# Altium project MAXM86161_ADPTR_EVKIT_B.PrjPcb
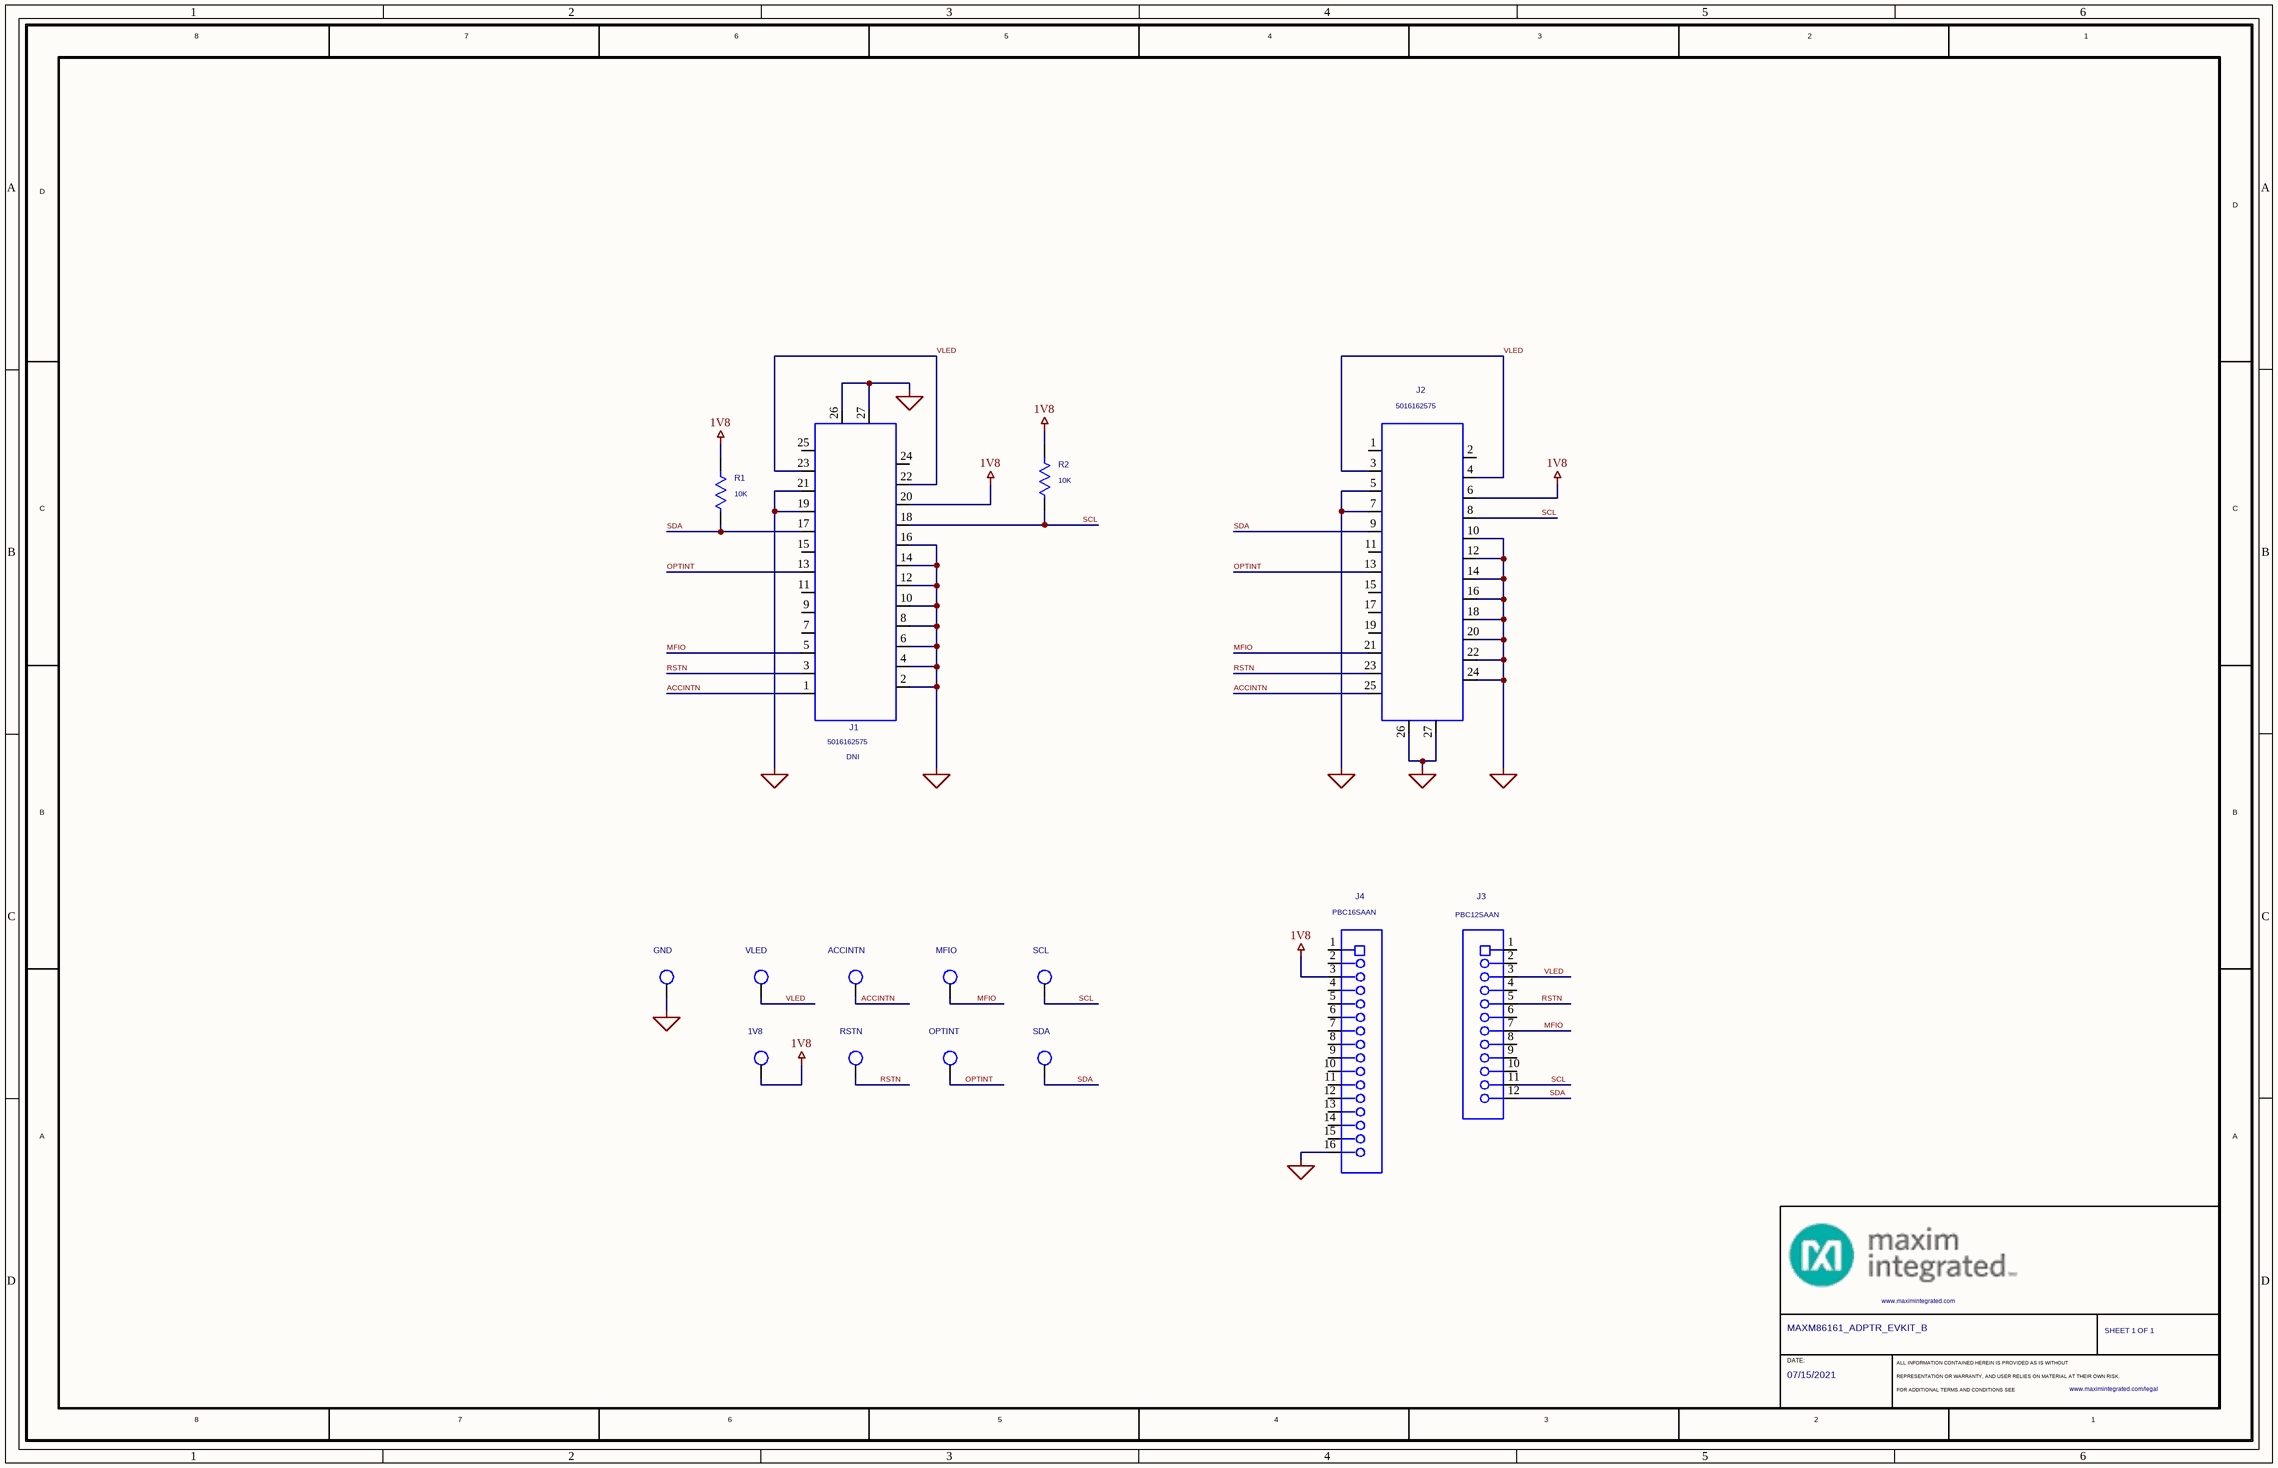
[diagram p0: MAXM86161_ADPTR_EVKIT_B.SchDoc]
1 sheet, 16 parts. Net scope: global (net labels, ports and power ports of the same name join across sheets).

## Sheet MAXM86161_ADPTR_EVKIT_B.SchDoc
size 426 x 274 mm

### Parts
1V8  N/A  [KEYS_5011]  (value not drawn)
*  CUSTOM_TXT_CDS21: SHEET 1 OF 1  PROJECT_TITLE: MAXM86161_ADPTR_EVKIT_B  DATE: 07/15/2021  (hidden comment: MAXIM_B_SIZE_CF)  (graphical)
ACCINTN  N/A  [KEYS_5013]  (value not drawn)
GND  N/A  [KEYS_5011]  (value not drawn)
J1  5016162575  LABEL: DNI  [MOLEX_501616-2575]
J2  5016162575  [MOLEX_501616-2575]
J3  PBC12SAAN  [SULLINS_PXC12SAAN]
J4  PBC16SAAN  [SULLINS_PXC16SAAN]
MFIO  N/A  [KEYS_5127]  (value not drawn)
OPTINT  N/A  [KEYS_5126]  (value not drawn)
R1  10K  [RESC6432X76M]
R2  10K  [RESC6432X76M]
RSTN  N/A  [KEYS_5014]  (value not drawn)
SCL  N/A  [KEYSTONE_5128]  (value not drawn)
SDA  N/A  [TP_C340H160]  (value not drawn)
VLED  N/A  [KEYS_5012]  (value not drawn)

### Nets
1V8: 1V8.1(TP1) J1.20 J2.6 J4.3 R1.1 R2.1
GND_SIGNAL_1: GND.1(TP1) J1.2 J1.4 J1.6 J1.8 J1.10 J1.12 J1.14 J1.16 J1.19 J1.21 J1.26 J1.27 J2.5 J2.7 J2.10 J2.12 J2.14 J2.16 J2.18 J2.20 J2.22 J2.24 J2.26 J2.27 J4.16
ACCINTN: ACCINTN.1(TP1) J1.1 J2.25
MFIO: J1.5 J2.21 J3.7 MFIO.1(TP1)
OPTINT: J1.13 J2.13 OPTINT.1(TP1)
RSTN: J1.3 J2.23 J3.5 RSTN.1(TP1)
SCL: J1.18 J2.8 J3.11 R2.2 SCL.1(TP1)
SDA: J1.17 J2.9 J3.12 R1.2 SDA.1(TP1)
VLED: J1.22 J1.23 J2.3 J2.4 J3.3 VLED.1(TP1)

Not connected (* = marked no-connect by the designer): J1 7 9 11 15 24 25; J2 1 2 11 15 17 19; J3 1 2 4 6 8 9 10; J4 1 2 4 5 6 7 8 9 10 11 12 13 14 15

### Notes on the sheet
- (in symbol MAXIM_B_SIZE_CF) 8; 7; 6; 5; 4; 3; 2; D; C; B; A; DATE:; ALL INFORMATION CONTAINED HEREIN IS PROVIDED AS IS WITHOUT; REPRESENTATION OR WARRANTY, AND USER RELIES ON MATERIAL AT THEIR OWN RISK.; FOR ADDITIONAL TERMS AND CONDITIONS SEE

### Library data of the parts
1V8 GND = TP: TEST POINT; PIN DIA=0.125IN; TOTAL LENGTH=0.445IN; BOARD HOLE=0.063IN; BLACK; PHOSPHOR BRONZE WIRE SILVER PLATE FINISH; RECOMMENDED FOR BOARD THICKNESS=0.062IN; NOT FOR COLD TEST; MFG_PART_NUMBER: 5011; MANUFACTURER: KEYSTONE; OriginalSymbolOrigin: (-125,50); MAXINV: 02-TPMINI5011-00; DRAWING: @MAXM86161_ADPTR_EVKIT_B_LIB.MAXM86161_ADPTR_EVKIT_B(SCH_1):PAGE2; PHYS_PAGE: 1; PACK_TYPE: TP; PCB Footprint_: KEYS_5011; PART_NAME: TP; REFLOW: -; TOLERANCE: N/A; VER: 1; VOLTAGE_RATING: N/A; TEMP_RANGE: N/A
* = MAXIM_B_SIZE_CF: OriginalSymbolOrigin: (175,5230); COMMENT_BODY: TRUE; Page Number: 1; CURRENT_DESIGN_SHEET: Page_1; LEAGAL_WEBLINK: www.maximintegrated.com/legal; WEBLINK1: www.maximintegrated.com
ACCINTN = TP: TEST POINT; PIN DIA=0.125IN; TOTAL LENGTH=0.445IN; BOARD HOLE=0.063IN; ORANGE; PHOSPHOR BRONZE WIRE SILVER PLATE FINISH; RECOMMENDED FOR BOARD THICKNESS=0.062IN; NOT FOR COLD TEST; MFG_PART_NUMBER: 5013; MANUFACTURER: KEYSTONE; OriginalSymbolOrigin: (-125,50); MAXINV: 02-TPMINI5013-00; DRAWING: @MAXM86161_ADPTR_EVKIT_B_LIB.MAXM86161_ADPTR_EVKIT_B(SCH_1):PAGE2; PHYS_PAGE: 1; PACK_TYPE: TP; PCB Footprint_: KEYS_5013; PART_NAME: TP; REFLOW: -; TOLERANCE: N/A; VER: 1; VOLTAGE_RATING: N/A; TEMP_RANGE: N/A
J1 = 501616-2575: CONNECTOR; FEMALE; SMT; EASY-ON TYPE FPC CONNECTOR; RIGHT ANGLE; 25PINS ;NOTE:DISCONTINUED BY MANUFACTURER; MANUFACTURER: MOLEX; OriginalSymbolOrigin: (-150,550); PACK_TYPE: RA; MAXINV: 01-501616257525P-29; DRAWING: @MAXM86161_ADPTR_EVKIT_B_LIB.MAXM86161_ADPTR_EVKIT_B(SCH_1):PAGE2; PHYS_PAGE: 1; VOLTAGE_RATING: +50V; TEMP_RANGE: -40 DEGC TO +85 DEGC; PCB Footprint_: MOLEX_501616-2575; MFG_PART_NUMBER: 5016162575; REFLOW: -; SEC_TYPE: RA; TOLERANCE: N/A; VARIANT: DNI; VER: 1
J2 = 501616-2575: CONNECTOR; FEMALE; SMT; EASY-ON TYPE FPC CONNECTOR; RIGHT ANGLE; 25PINS ;NOTE:DISCONTINUED BY MANUFACTURER; MANUFACTURER: MOLEX; OriginalSymbolOrigin: (-150,550); PACK_TYPE: RA; MAXINV: 01-501616257525P-29; DRAWING: @MAXM86161_ADPTR_EVKIT_B_LIB.MAXM86161_ADPTR_EVKIT_B(SCH_1):PAGE2; PHYS_PAGE: 1; VARIANT: DNI; VOLTAGE_RATING: +50V; TEMP_RANGE: -40 DEGC TO +85 DEGC; PCB Footprint_: MOLEX_501616-2575; MFG_PART_NUMBER: 5016162575; REFLOW: -; SEC_TYPE: RA; TOLERANCE: N/A; VER: 1
J3 = HEADER_12P: CONNECTOR; MALE; THROUGH HOLE; BREAKAWAY; STRAIGHT; 12PINS; -65 DEGC TO +125 DEGC; MANUFACTURER: SULLINS ELECTRONICS CORP.; OriginalSymbolOrigin: (-75,375); PACK_TYPE: SIP; MAXINV: 01-PBC12SAAN12P-21; DRAWING: @MAXM86161_ADPTR_EVKIT_B_LIB.MAXM86161_ADPTR_EVKIT_B(SCH_1):PAGE2; PHYS_PAGE: 1; PCB Footprint_: SULLINS_PXC12SAAN; MFG_PART_NUMBER: PBC12SAAN; REFLOW: -; SEC_TYPE: SIP; TOLERANCE: N/A; VER: 1; VOLTAGE_RATING: N/A; TEMP_RANGE: -65 DEGC TO +125 DEGC
J4 = HEADER_16P: CONNECTOR; MALE; THROUGH HOLE; BREAKAWAY; STRAIGHT; 16PINS; -65 DEGC TO +125 DEGC; MANUFACTURER: SULLINS ELECTRONICS CORP.; OriginalSymbolOrigin: (-75,475); PACK_TYPE: SIP; MAXINV: 01-PBC16SAAN16P-21; DRAWING: @MAXM86161_ADPTR_EVKIT_B_LIB.MAXM86161_ADPTR_EVKIT_B(SCH_1):PAGE2; PHYS_PAGE: 1; PCB Footprint_: SULLINS_PXC16SAAN; MFG_PART_NUMBER: PBC16SAAN; REFLOW: -; SEC_TYPE: SIP; TOLERANCE: N/A; VER: 1; VOLTAGE_RATING: N/A; TEMP_RANGE: -65 DEGC TO +125 DEGC
MFIO = TP: TEST POINT; PIN DIA=0.125IN; TOTAL LENGTH=0.445IN; BOARD HOLE=0.063IN; BLUE; PHOSPHOR BRONZE WIRE SILVER PLATE FINISH; RECOMMENDED FOR BOARD THICKNESS=0.062IN; NOT FOR COLD TEST; MFG_PART_NUMBER: 5127; MANUFACTURER: KEYSTONE; OriginalSymbolOrigin: (-125,50); MAXINV: 02-TPMULTI5127-00; DRAWING: @MAXM86161_ADPTR_EVKIT_B_LIB.MAXM86161_ADPTR_EVKIT_B(SCH_1):PAGE2; PHYS_PAGE: 1; PACK_TYPE: TP; PCB Footprint_: KEYS_5127; PART_NAME: TP; REFLOW: -; TOLERANCE: N/A; VER: 1; VOLTAGE_RATING: N/A; TEMP_RANGE: N/A
OPTINT = TP: TEST POINT; PIN DIA=0.125IN; TOTAL LENGTH=0.445IN; BOARD HOLE=0.063IN; GREEN; PHOSPHOR BRONZE WIRE SILVER PLATE FINISH; RECOMMENDED FOR BOARD THICKNESS=0.062IN; NOT FOR COLD TEST; MFG_PART_NUMBER: 5126; MANUFACTURER: KEYSTONE; OriginalSymbolOrigin: (-125,50); MAXINV: 02-TPMULTI5126-00; DRAWING: @MAXM86161_ADPTR_EVKIT_B_LIB.MAXM86161_ADPTR_EVKIT_B(SCH_1):PAGE2; PHYS_PAGE: 1; PACK_TYPE: TP; PCB Footprint_: KEYS_5126; PART_NAME: TP; REFLOW: -; TOLERANCE: N/A; VER: 1; VOLTAGE_RATING: N/A; TEMP_RANGE: N/A
R1 = RES_SMD: RES; SMT (2512); 10K; 1%; +/-100PPM/DEGC; 2W; MFG_PART_NUMBER: HVC2512K1002FT; MANUFACTURER: OHMCRAFT; OriginalSymbolOrigin: (-50,75); PACK_TYPE: 2512RES; MAXINV: 80-0010K-AA72; DRAWING: @MAXM86161_ADPTR_EVKIT_B_LIB.MAXM86161_ADPTR_EVKIT_B(SCH_1):PAGE2; PHYS_PAGE: 1; RES: 1.00E04; VER: 4; TEMP_RANGE: -55 DEGC TO +150 DEGC; VLOG_PARAM01: RES:INTEGER; MATERIAL_TYPE: THICK FILM; PCB Footprint_: RESC6432X76M; CASE: SMT (2512); POWER_RATING: 2W; REFLOW: -; TOLERANCE: 1%
R2 = RES_SMD: RES; SMT (2512); 10K; 1%; +/-100PPM/DEGC; 2W; MFG_PART_NUMBER: HVC2512K1002FT; MANUFACTURER: OHMCRAFT; OriginalSymbolOrigin: (-50,75); PACK_TYPE: 2512RES; MAXINV: 80-0010K-AA72; DRAWING: @MAXM86161_ADPTR_EVKIT_B_LIB.MAXM86161_ADPTR_EVKIT_B(SCH_1):PAGE2; PHYS_PAGE: 1; RES: 1.00E04; VER: 4; TEMP_RANGE: -55 DEGC TO +150 DEGC; MATERIAL_TYPE: THICK FILM; VLOG_PARAM01: RES:INTEGER; PCB Footprint_: RESC6432X76M; CASE: SMT (2512); POWER_RATING: 2W; REFLOW: -; TOLERANCE: 1%
RSTN = TP: TEST POINT; PIN DIA=0.125IN; TOTAL LENGTH=0.445IN; BOARD HOLE=0.063IN; YELLOW; PHOSPHOR BRONZE WIRE SILVER PLATE FINISH; RECOMMENDED FOR BOARD THICKNESS=0.062IN; NOT FOR COLD TEST; MFG_PART_NUMBER: 5014; MANUFACTURER: KEYSTONE; OriginalSymbolOrigin: (-125,50); MAXINV: 02-TPMINI5014-00; DRAWING: @MAXM86161_ADPTR_EVKIT_B_LIB.MAXM86161_ADPTR_EVKIT_B(SCH_1):PAGE2; PHYS_PAGE: 1; PACK_TYPE: TP; PCB Footprint_: KEYS_5014; PART_NAME: TP; REFLOW: -; TOLERANCE: N/A; VER: 1; VOLTAGE_RATING: N/A; TEMP_RANGE: N/A
SCL = TP: TEST POINT; PIN DIA=0.125IN; TOTAL LENGTH=0.445IN; BOARD HOLE=0.063IN; GREY; PHOSPHOR BRONZE WIRE SILVER PLATE FINISH; RECOMMENDED FOR BOARD THICKNESS=0.062IN; NOT FOR COLD TEST; MFG_PART_NUMBER: 5128; MANUFACTURER: KEYSTONE; OriginalSymbolOrigin: (-125,50); MAXINV: 02-TPMULTI5128-00; DRAWING: @MAXM86161_ADPTR_EVKIT_B_LIB.MAXM86161_ADPTR_EVKIT_B(SCH_1):PAGE2; PHYS_PAGE: 1; PACK_TYPE: TP; PCB Footprint_: KEYSTONE_5128; PART_NAME: TP; REFLOW: -; TOLERANCE: N/A; VER: 1; VOLTAGE_RATING: N/A; TEMP_RANGE: N/A
SDA = TP: TEST POINT; PIN DIA=0.125IN; TOTAL LENGTH=0.445IN; BOARD HOLE=0.063IN; BROWN; PHOSPHOR BRONZE WIRE SILVER PLATE FINISH; RECOMMENDED FOR BOARD THICKNESS=0.062IN; NOT FOR COLD TEST; MFG_PART_NUMBER: 5125; MANUFACTURER: KEYSTONE; OriginalSymbolOrigin: (-125,50); MAXINV: 02-TPMINI5125-00; DRAWING: @MAXM86161_ADPTR_EVKIT_B_LIB.MAXM86161_ADPTR_EVKIT_B(SCH_1):PAGE2; PHYS_PAGE: 1; PACK_TYPE: TP; PCB Footprint_: TP_C340H160; PART_NAME: TP; REFLOW: -; TOLERANCE: N/A; VER: 1; VOLTAGE_RATING: N/A; TEMP_RANGE: N/A
VLED = TP: TEST POINT; PIN DIA=0.125IN; TOTAL LENGTH=0.445IN; BOARD HOLE=0.063IN; WHITE; PHOSPHOR BRONZE WIRE SILVER PLATE FINISH; RECOMMENDED FOR BOARD THICKNESS=0.062IN; NOT FOR COLD TEST; MFG_PART_NUMBER: 5012; MANUFACTURER: KEYSTONE; OriginalSymbolOrigin: (-125,50); MAXINV: 02-TPMINI5012-00; DRAWING: @MAXM86161_ADPTR_EVKIT_B_LIB.MAXM86161_ADPTR_EVKIT_B(SCH_1):PAGE2; PHYS_PAGE: 1; PACK_TYPE: TP; PCB Footprint_: KEYS_5012; PART_NAME: TP; REFLOW: -; TOLERANCE: N/A; VER: 1; VOLTAGE_RATING: N/A; TEMP_RANGE: N/A